# Altium schematic sheet 05_ETHERNET_USB.SchDoc: Схема электрическая принципиальная
size 420 x 297 mm; ApprovedBy: Скрябин; CheckedBy: Скрябин; Author: Корсунов; CompanyName: РТУ МИРЭА; SheetNumber: 5; SheetTotal: 11; PageSetup: Record=PageOptions|CenterHorizontal=True|CenterVertical=True|PrintScale=0.94|XCorrection=1.00|YCorrection=1.00|PrintKind=1|BorderSize=5000000|LeftOffset=0|BottomOffset=0|Orientation=1|PaperLength=1000|PaperWidth=1000|Scale=100|PaperSource=7|PrintQuality=-4|MediaType=1|DitherType=10|PaperKind=A4|PrintScaleMode=1; DecimalNumber: RP23.000001.005 Э3; Name1: Модуль ввода-вывода; lit_A: О; Name2: RP2350 OPC UA
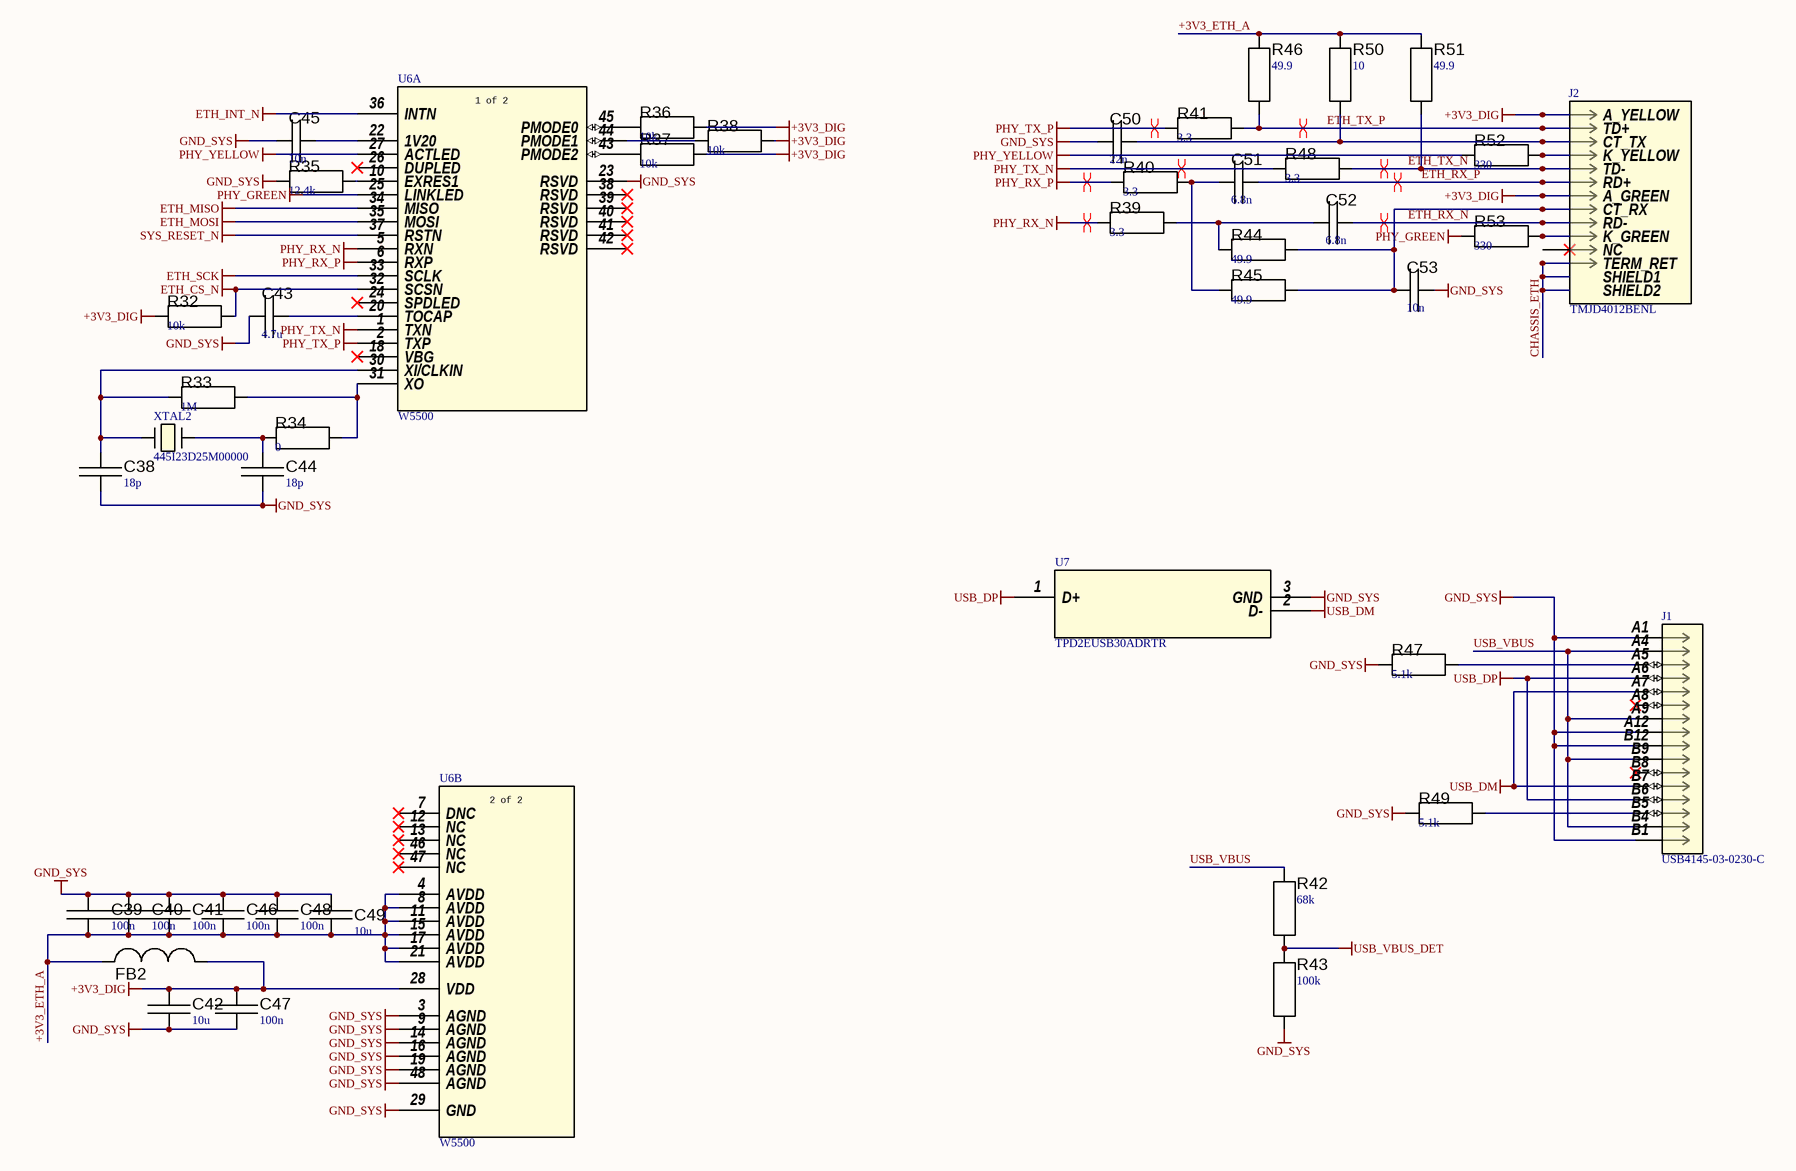
[diagram p0: 05_ETHERNET_USB.SchDoc]

## Parts
C38  value 18p  [C_0603]  (hidden comment: Capacitor)
C39  value 100n  [C_0603]  (hidden comment: Capacitor)
C40  value 100n  [C_0603]  (hidden comment: Capacitor)
C41  value 100n  [C_0603]  (hidden comment: Capacitor)
C42  value 10u  [C_0805]  (hidden comment: Capacitor)
C43  value 4.7u  [C_1206]  (hidden comment: Capacitor)
C44  value 18p  [C_0603]  (hidden comment: Capacitor)
C45  value 10n  [C_0603]  (hidden comment: Capacitor)
C46  value 100n  [C_0603]  (hidden comment: Capacitor)
C47  value 100n  [C_0603]  (hidden comment: Capacitor)
C48  value 100n  [C_0603]  (hidden comment: Capacitor)
C49  value 10u  [C_0805]  (hidden comment: Capacitor)
C50  value 22n  [C_0603]  (hidden comment: Capacitor)
C51  value 6.8n  [C_0603]  (hidden comment: Capacitor)
C52  value 6.8n  [C_0603]  (hidden comment: Capacitor)
C53  value 10n  [C_0603]  (hidden comment: Capacitor)
FB2  120R 100MHz  [L_0805]  (value not drawn)
J1  USB4145-03-0230-C  [CONN_USB4145-03-0230-C_GCT]
J2  TMJD4012BENL  [CONN12_TMJD4012BENL_TAL]
R32  value 10k  [R_0603]  (hidden comment: Resistor)
R33  value 1M  [R_0603]  (hidden comment: Resistor)
R34  value 0  [R_0603]  (hidden comment: Resistor)
R35  value 12.4k  [R_0603]  (hidden comment: Resistor)
R36  value 10k  [R_0603]  (hidden comment: Resistor)
R37  value 10k  [R_0603]  (hidden comment: Resistor)
R38  value 10k  [R_0603]  (hidden comment: Resistor)
R39  value 3.3  [R_0603]  (hidden comment: Resistor)
R40  value 3.3  [R_0603]  (hidden comment: Resistor)
R41  value 3.3  [R_0603]  (hidden comment: Resistor)
R42  value 68k  [R_0603]  (hidden comment: Resistor)
R43  value 100k  [R_0603]  (hidden comment: Resistor)
R44  value 49.9  [R_0603]  (hidden comment: Resistor)
R45  value 49.9  [R_0603]  (hidden comment: Resistor)
R46  value 49.9  [R_0603]  (hidden comment: Resistor)
R47  value 5.1k  [R_0603]  (hidden comment: Resistor)
R48  value 3.3  [R_0603]  (hidden comment: Resistor)
R49  value 5.1k  [R_0603]  (hidden comment: Resistor)
R50  value 10  [R_0603]  (hidden comment: Resistor)
R51  value 49.9  [R_0603]  (hidden comment: Resistor)
R52  value 330  [R_0603]  (hidden comment: Resistor)
R53  value 330  [R_0603]  (hidden comment: Resistor)
U6  W5500  [48LQFP_W5500_WIZ]  (parts A,B of 2)
U7  TPD2EUSB30ADRTR  [DRT3]
XTAL2  445I23D25M00000  [XTAL_445I23D25M00000_CTS]

## Nets
+3V3_DIG: C42.2 C47.2 FB2.2 J2.9(A_YELLOW) J2.11(A_GREEN) R32.1 R36.2 R37.2 R38.2 U6.28(VDD)
ETH_CS_N: R32.2 U6.32(SCSN)
ETH_INT_N: U6.36(INTN)
ETH_MISO: U6.34(MISO)
ETH_MOSI: U6.35(MOSI)
ETH_SCK: U6.33(SCLK)
GND_SYS: C38.1 C39.2 C40.2 C41.2 C42.1 C43.1 C44.1 C45.1 C46.2 C47.1 C48.2 C49.2 C50.1 C53.2 J1.A1(GND) J1.A12(GND) J1.B1(GND) J1.B12(GND) R35.1 R43.1 R47.1 R49.1 U6.3(AGND) U6.9(AGND) U6.14(AGND) U6.16(AGND) U6.19(AGND) U6.23(RSVD) U6.29(GND) U6.48(AGND) U7.3(GND)
PHY_GREEN: R53.1 U6.25(LINKLED)
PHY_RX_N: R39.1 U6.5(RXN)
PHY_RX_P: R40.1 U6.6(RXP)
PHY_TX_N: R48.1 U6.1(TXN)
PHY_TX_P: R41.1 U6.2(TXP)
PHY_YELLOW: R52.1 U6.27(ACTLED)
SYS_RESET_N: U6.37(RSTN)
USB_DM: J1.A7(DN1) J1.B7(DN2) U7.2(D-)
USB_DP: J1.A6(DP1) J1.B6(DP2) U7.1(D+)
USB_VBUS_DET: R42.1 R43.2
+3V3_ETH_A: C39.1 C40.1 C41.1 C46.1 C48.1 C49.1 FB2.1 R46.2 R50.2 R51.2 U6.4(AVDD) U6.8(AVDD) U6.11(AVDD) U6.15(AVDD) U6.17(AVDD) U6.21(AVDD)
CHASSIS_ETH: J2.8(TERM_RET) J2.14(SHIELD1) J2.16(SHIELD2)
ETH_RX_N: C52.2 J2.6(RD-)
ETH_RX_P: C51.2 J2.4(RD+)
ETH_TX_N: J2.3(TD-) R48.2 R51.1
ETH_TX_P: J2.1(TD+) R41.2 R46.1
USB_VBUS: J1.A4(VBUS) J1.A9(VBUS) J1.B4(VBUS) J1.B9(VBUS) R42.2
NetC38_2: C38.2 R33.1 U6.30(XI/CLKIN) XTAL2.1
NetC43_2: C43.2 U6.20(TOCAP)
NetC44_2: C44.2 R34.1 XTAL2.2
NetC45_2: C45.2 U6.22(1V20)
NetC50_2: C50.2 J2.2(CT_TX) R50.1
NetC51_1: C51.1 R40.2 R45.1
NetC52_1: C52.1 R39.2 R44.1
NetC53_1: C53.1 J2.5(CT_RX) R44.2 R45.2
NetJ1_A5: J1.A5(CC1) R47.2
NetJ1_B5: J1.B5(CC2) R49.2
NetJ2_10: J2.10(K_YELLOW) R52.2
NetJ2_12: J2.12(K_GREEN) R53.2
NetR33_2: R33.2 R34.2 U6.31(XO)
NetR35_2: R35.2 U6.10(EXRES1)
NetR36_1: R36.1 U6.45(PMODE0)
NetR37_1: R37.1 U6.43(PMODE2)
NetR38_1: R38.1 U6.44(PMODE1)

Not connected (* = marked no-connect by the designer): J1 A8(SBU1)* B8(SBU2)*; J2 7(NC); U6 7(DNC)* 12(NC)* 13(NC)* 18(VBG)* 24(SPDLED)* 26(DUPLED)* 38(RSVD)* 39(RSVD)* 40(RSVD)* 41(RSVD)* 42(RSVD)* 46(NC)* 47(NC)*

## Layout directives
differential pair: ETH_RX_N, ETH_RX_P, ETH_TX_N, ETH_TX_P, PHY_RX_N, PHY_RX_P, PHY_TX_N, PHY_TX_P

## Notes on the sheet
- Перв.примен.
- Справ.№
- Подп. и дата
- Инв.№ дубл.
- Взам.инв.№
- Подп.и дата
- Разраб.
- Изм.
- Лист
- № докум.
- Подп.
- Дата
- Лит.
- Масштаб
- Масса
- Т.контр.
- Пров.
- СХЕМА   ЭЛЕКТРИЧЕСКАЯ
- ПРИНЦИПИАЛЬНАЯ
- Листов
- Инв.№ подл.
- Утв.
- Н.контр.
- Нач.сект.
- Формат  A3
- (in symbol W5500, part A) 1 of 2
- (in symbol W5500, part B) 2 of 2

## Library data of the parts
C38-C53 = Capacitor: SimulationGenericComponent: True
FB2 = Ferrite Chip: SMT Ferrite Chip
J1 = USB4145-03-0230-C: Description; Manufacturer_Name: Global Connector Technology; Copyright: Copyright (C) 2026 Ultra Librarian. All rights reserved.; Manufacturer_Part_Number: USB4145-03-0230-C; RefDes: RefDes; Type: Type
J2 = TMJD4012BENL: No Description Available; Manufacturer_Name: Taoglas Limited; Type: Modular Connector Jacks With Magnetics; Copyright: Copyright (C) 2026 Ultra Librarian. All rights reserved.; Manufacturer_Part_Number: TMJD4012BENL; RefDes: RefDes
R32 R33 R35-R53 = Resistor: TC1: 0; SimulationGenericComponent: True; TC2: 0
R34 = Resistor: SimulationGenericComponent: True; TC1: 0; TC2: 0
U6 = W5500: Description; Manufacturer_Name: WIZnet; Copyright: Copyright (C) 2025 Ultra Librarian. All rights reserved.; Manufacturer_Part_Number: W5500; RefDes: RefDes; Type: Type
U7 = TPD2EUSB30ADRTR: Dual 0.7-pF, 3.6-V, &plusmn;8-kV ESD protection diode with 5-A surge rating for USB 3.0 3-SOT-9X3 -40 to 85; Manufacturer_Name: Texas Instruments; Copyright: Copyright (C) 2026 Ultra Librarian. All rights reserved.; Manufacturer_Part_Number: TPD2EUSB30ADRTR; RefDes: RefDes; Type: Type
XTAL2 = 445I23D25M00000: Description; Manufacturer_Name: CTS Components; Copyright: Copyright (C) 2025 Ultra Librarian. All rights reserved.; Manufacturer_Part_Number: 445I23D25M00000